# Altium schematic sheet 05-MCU.SchDoc: MCU
size A4; Organization: ORGANIZATION; Address1: ADDRESS 1; Address2: ADDRESS 2; Address3: ADDRESS 3; Address4: ADDRESS 4; SheetNumber: 5; SheetTotal: 7; ENG_APP_DATE: --/--/--; DSN_APP_DATE: --/--/--; CHK_APP_DATE: --/--/--
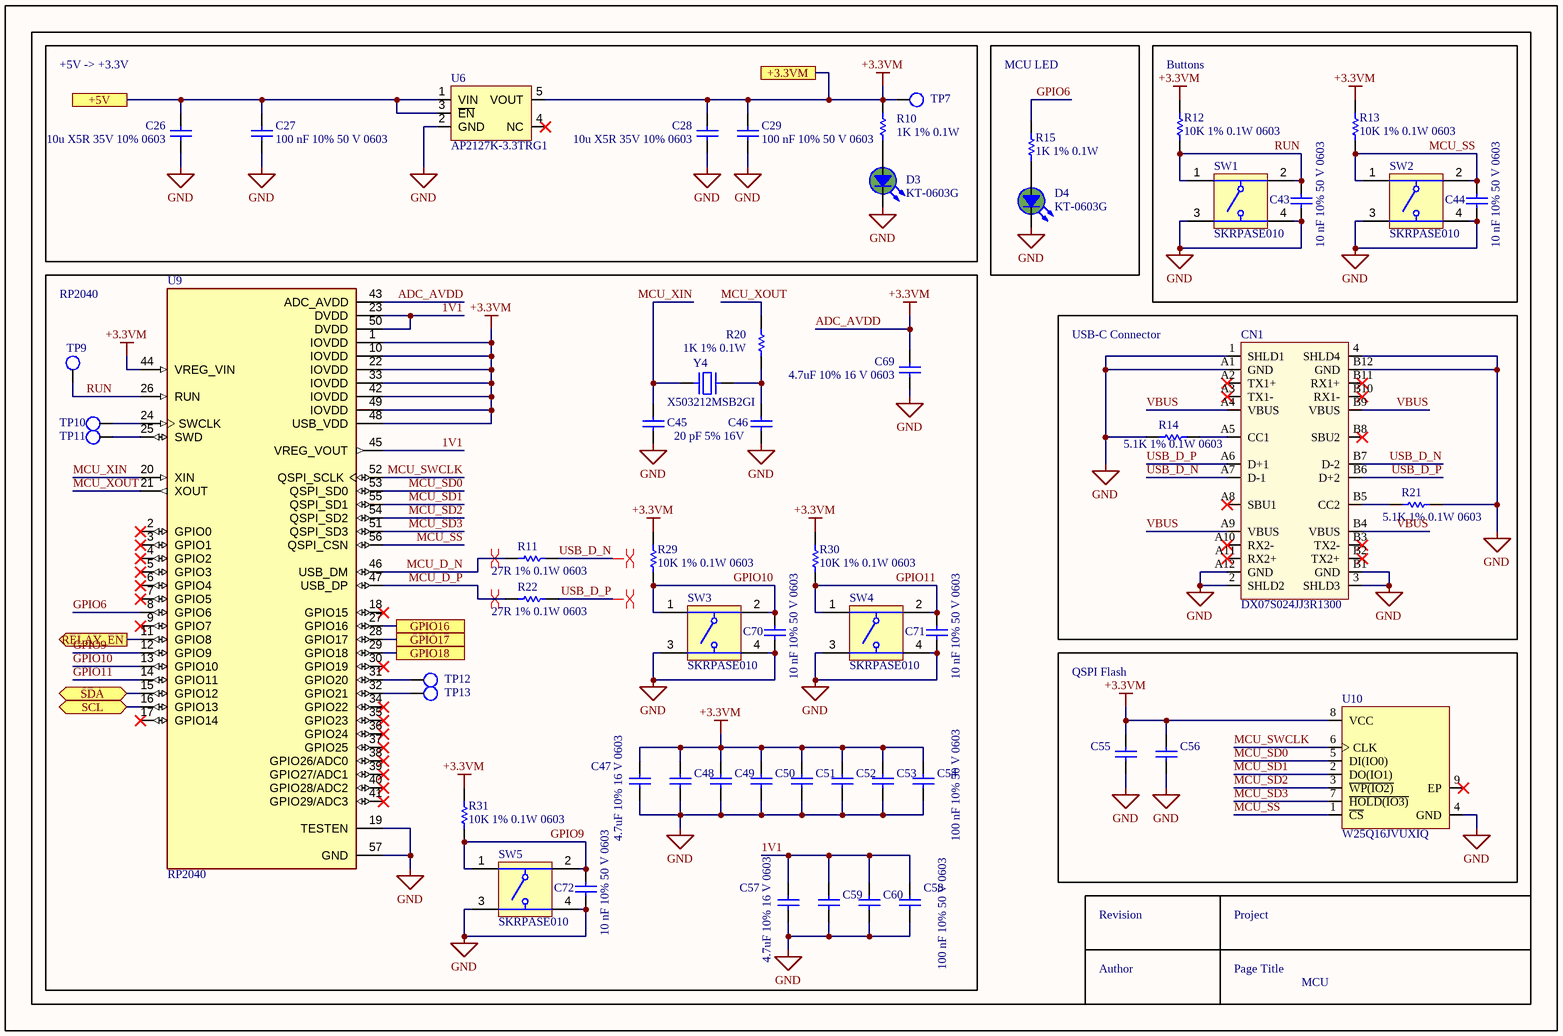
[diagram p0: 05-MCU.SchDoc]

## Parts
C26  10u X5R 35V 10% 0603  [C0603]
C27  100 nF 10% 50 V 0603  [CAPC1608X90X40NL10T20]
C28  10u X5R 35V 10% 0603  [C0603]
C29  100 nF 10% 50 V 0603  [CAPC1608X90X40NL10T20]
C43  10 nF 10% 50 V 0603  [CAPC1608X90X40NL10T20]
C44  10 nF 10% 50 V 0603  [CAPC1608X90X40NL10T20]
C45  20 pF 5% 16V  [CAPC1608X90X40NL10T20]
C46  20 pF +/- 5% 16 V 0603  [CAPC1608X90X40NL10T20]  (value not drawn)
C47  4.7uF 10% 16 V 0603  [CAPC1608X90X40NL10T20]
C48  100 nF 10% 50 V 0603  [CAPC1608X90X40NL10T20]  (value not drawn)
C49  100 nF 10% 50 V 0603  [CAPC1608X90X40NL10T20]  (value not drawn)
C50  100 nF 10% 50 V 0603  [CAPC1608X90X40NL10T20]  (value not drawn)
C51  100 nF 10% 50 V 0603  [CAPC1608X90X40NL10T20]  (value not drawn)
C52  100 nF 10% 50 V 0603  [CAPC1608X90X40NL10T20]  (value not drawn)
C53  100 nF 10% 50 V 0603  [CAPC1608X90X40NL10T20]  (value not drawn)
C54  100 nF 10% 50 V 0603  [CAPC1608X90X40NL10T20]
C55  4.7uF 10% 16 V 0603  [CAPC1608X90X40NL10T20]  (value not drawn)
C56  100 nF 10% 50 V 0603  [CAPC1608X90X40NL10T20]  (value not drawn)
C57  4.7uF 10% 16 V 0603  [CAPC1608X90X40NL10T20]
C58  100 nF 10% 50 V 0603  [CAPC1608X90X40NL10T20]
C59  100 nF 10% 50 V 0603  [CAPC1608X90X40NL10T20]  (value not drawn)
C60  100 nF 10% 50 V 0603  [CAPC1608X90X40NL10T20]  (value not drawn)
C69  4.7uF 10% 16 V 0603  [CAPC1608X90X40NL10T20]
C70  10 nF 10% 50 V 0603  [CAPC1608X90X40NL10T20]
C71  10 nF 10% 50 V 0603  [CAPC1608X90X40NL10T20]
C72  10 nF 10% 50 V 0603  [CAPC1608X90X40NL10T20]
CN1  DX07S024JJ3R1300  [JAE-DX07S024JJ3_V]
D3  KT-0603G  [LED-0603-RED]
D4  KT-0603G  [LED-0603-RED]
R10  1K 1% 0.1W  [R0603]
R11  27R 1% 0.1W 0603  [R0603]
R12  10K 1% 0.1W 0603  [R0603]
R13  10K 1% 0.1W 0603  [R0603]
R14  5.1K 1% 0.1W 0603  [R0603]
R15  1K 1% 0.1W  [R0603]
R20  1K 1% 0.1W  [R0603]
R21  5.1K 1% 0.1W 0603  [R0603]
R22  27R 1% 0.1W 0603  [R0603]
R29  10K 1% 0.1W 0603  [R0603]
R30  10K 1% 0.1W 0603  [R0603]
R31  10K 1% 0.1W 0603  [R0603]
SW1  SKRPASE010  [SKRPASE010]
SW2  SKRPASE010  [SKRPASE010]
SW3  SKRPASE010  [SKRPASE010]
SW4  SKRPASE010  [SKRPASE010]
SW5  SKRPASE010  [SKRPASE010]
TP7  Touchpoint  [Touchpoint-Footprint-1]  (value not drawn)  (no BOM)
TP9  Touchpoint  [Touchpoint-Footprint-1]  (value not drawn)  (no BOM)
TP10  Touchpoint  [Touchpoint-Footprint-1]  (value not drawn)  (no BOM)
TP11  Touchpoint  [Touchpoint-Footprint-1]  (value not drawn)  (no BOM)
TP12  Touchpoint  [Touchpoint-Footprint-1]  (value not drawn)  (no BOM)
TP13  Touchpoint  [Touchpoint-Footprint-1]  (value not drawn)  (no BOM)
U6  AP2127K-3.3TRG1  [FP-SOT25-IPC_B]
U9  RP2040  [QFN40P700X700X90-57N]
U10  W25Q16JVUXIQ  [FP-UX-IPC_B]
Y4  X503212MSB2GI  [X50328MSB2GI-Footprint-1]

## Blocks framed on the sheet
+5V -> +3.3V: C26-C29 D3 R10 TP7 U6
MCU LED: D4 R15
Buttons: C43 C44 R12 R13 SW1 SW2
RP2040: C45-C54 C57-C60 C69-C72 R11 R20 R22 R29-R31 SW3-SW5 TP9-TP13 U9 Y4
USB-C Connector: CN1 R14 R21
QSPI Flash: C55 C56 U10

## Ports
+3.3VM, +5V, GPIO16, GPIO17, GPIO18, RELAY_EN (out), SCL (bidir), SDA (bidir)

## Nets
ADC_AVDD: C28.2 C29.2 C47.2 C48.2 C49.2 C50.2 C51.2 C52.2 C53.2 C54.2 C55.2 C56.2 C69.2 R10.1 R12.2 R13.2 R29.2 R30.2 R31.2 TP7.0 U6.5(VOUT) U9.1(IOVDD) U9.10(IOVDD) U9.22(IOVDD) U9.33(IOVDD) U9.42(IOVDD) U9.43(ADC_AVDD) U9.44(VREG_VIN) U9.48(USB_VDD) U9.49(IOVDD) U10.8(VCC) ; port +3.3VM  [also labelled +3.3VM]
GND: C26.1 C27.1 C28.1 C29.1 C43.1 C44.1 C45.1 C46.1 C47.1 C48.1 C49.1 C50.1 C51.1 C52.1 C53.1 C54.1 C55.1 C56.1 C57.1 C58.1 C59.1 C60.1 C69.1 C70.1 C71.1 C72.1 CN1.1(SHLD1) CN1.2(SHLD2) CN1.3(SHLD3) CN1.4(SHLD4) CN1.A1(GND) CN1.A12(GND) CN1.B1(GND) CN1.B12(GND) D3.2 D4.2 R14.2 R21.1 SW1.3 SW1.4 SW2.3 SW2.4 SW3.3 SW3.4 SW4.3 SW4.4 SW5.3 SW5.4 U6.2(GND) U9.19(TESTEN) U9.57(GND) U10.4(GND)
1V1: C57.2 C58.2 C59.2 C60.2 U9.23(DVDD) U9.45(VREG_VOUT) U9.50(DVDD)
+5V: C26.2 C27.2 U6.1(VIN) U6.3(~{EN}) ; port +5V
GPIO6: R15.1 U9.8(GPIO6)
GPIO9: C72.2 R31.1 SW5.1 SW5.2 U9.12(GPIO9)
GPIO10: C70.2 R29.1 SW3.1 SW3.2 U9.13(GPIO10)
GPIO11: C71.2 R30.1 SW4.1 SW4.2 U9.14(GPIO11)
GPIO16: U9.27(GPIO16) ; port GPIO16
GPIO17: U9.28(GPIO17) ; port GPIO17
GPIO18: U9.29(GPIO18) ; port GPIO18
MCU_D_N: R11.1 U9.46(USB_DM)
MCU_D_P: R22.1 U9.47(USB_DP)
MCU_SD0: U9.53(QSPI_SD0) U10.5(DI(IO0))
MCU_SD1: U9.55(QSPI_SD1) U10.2(DO(IO1))
MCU_SD2: U9.54(QSPI_SD2) U10.3(~{WP(IO2)})
MCU_SD3: U9.51(QSPI_SD3) U10.7(~{HOLD(IO3)})
MCU_SS: C44.2 R13.1 SW2.1 SW2.2 U9.56(QSPI_CSN) U10.1(~{CS})
MCU_SWCLK: U9.52(QSPI_SCLK) U10.6(CLK)
MCU_XIN: C45.2 U9.20(XIN) Y4.2
MCU_XOUT: R20.2 U9.21(XOUT)
RELAY_EN: U9.11(GPIO8) ; port RELAY_EN
RUN: C43.2 R12.1 SW1.1 SW1.2 TP9.0 U9.26(RUN)
SCL: U9.16(GPIO13) ; port SCL
SDA: U9.15(GPIO12) ; port SDA
USB_D_N: CN1.A7(D-1) CN1.B7(D-2) R11.2
USB_D_P: CN1.A6(D+1) CN1.B6(D+2) R22.2
VBUS: CN1.A4(VBUS) CN1.A9(VBUS) CN1.B4(VBUS) CN1.B9(VBUS)
NetC46_2: C46.2 R20.1 Y4.1
NetCN1_A5: CN1.A5(CC1) R14.1
NetCN1_B5: CN1.B5(CC2) R21.2
NetD3_1: D3.1 R10.2
NetD4_1: D4.1 R15.2
NetTP10_0: TP10.0 U9.24(SWCLK)
NetTP11_0: TP11.0 U9.25(SWD)
NetTP12_0: TP12.0 U9.31(GPIO20)
NetTP13_0: TP13.0 U9.32(GPIO21)

Not connected (* = marked no-connect by the designer): CN1 A2(TX1+)* A3(TX1-)* A8(SBU1)* A10(RX2-)* A11(RX2+)* B2(TX2+)* B3(TX2-)* B8(SBU2)* B10(RX1-)* B11(RX1+)*; U6 4(NC)*; U9 2(GPIO0)* 3(GPIO1)* 4(GPIO2)* 5(GPIO3)* 6(GPIO4)* 7(GPIO5)* 9(GPIO7)* 17(GPIO14)* 18(GPIO15)* 30(GPIO19)* 34(GPIO22)* 35(GPIO23)* 36(GPIO24)* 37(GPIO25)* 38(GPIO26/ADC0)* 39(GPIO27/ADC1)* 40(GPIO28/ADC2)* 41(GPIO29/ADC3)*; U10 9(EP)*

## Layout directives
differential pair: MCU_D_N, MCU_D_P, USB_D_N, USB_D_P

## Notes on the sheet
- Revision
- Project
- Author
- Page Title

## Library data of the parts
C26 C28 = CMP-001-00153-3: MLCC 10u X5R 35V 10% 0603; MFR_Part_#: GRM188R6YA106MA73D; Manufacturer: Generic; Dielectric: X7R; Component Type: Standard; PartNumber: 10u X5R 35V 10% 0603; Value: 10u; LCSC_Part_#: C194427; Tolerance: 10%; Pin Count: 2; Status: Preferred; Source: GT_WH_Control.SCHLIB; Voltage: 35V; LCSC_Price_1ku: 0.0213; Design Item ID: 10u X5R 35V 10% 0603
C27 C29 C48-C54 C56 C58-C60 = CMP-001-00017-8: Chip Capacitor, 100 nF, +/- 10%, 50 V, 0603 (1608 Metric); MFR_Part_#: CC0603KRX7R9BB104; Voltage Rating: 50V; Value: 100nF; Capacitor Type: Ceramic; Mounting Technology: SM; LCSC_Price_1ku: 0.0015; Pins: 2; RoHS Compliant: True; LCSC_Part_#: C14663; Max Operating Temperature: 125°C; Tolerance: 10%; Case/Package: 0603; Min Operating Temperature: -55°C
C43 C44 C70-C72 = CMP-001-00194-3: Chip Capacitor, 10 nF, +/- 10%, 50 V, 0603 (1608 Metric); MFR_Part_#: 0603B103K500NT; Voltage Rating: 50V; Value: 10nF; Capacitor Type: Ceramic; Mounting Technology: SM; Case/Package: 0603; LCSC_Part_#: C57112; Max Operating Temperature: 125°C; Min Operating Temperature: -55°C; Tolerance: 10%; LCSC_Price_1ku: 0.0015; Pins: 2; RoHS Compliant: True
C45 C46 = CMP-001-00200-2: Chip Capacitor, 20 pF, +/- 5%, 16V, 0603 (1608 Metric); MFR_Part_#: CC0603JRNPO7BN200; Capacitor Type: Ceramic; Value: 20pF; Tolerance: 5%; Pins: 2; LCSC_Price_1ku: 0.0022; Voltage Rating: 16V; Mounting Technology: SM; LCSC_Part_#: C2190570; Min Operating Temperature: -55°C; Case/Package: 0603; RoHS Compliant: True
C47 C55 C57 C69 = CMP-001-00201-1: Chip Capacitor, 4.7uF, +/- 10%, 16V, 0603 (1608 Metric); MFR_Part_#: CL10A475KO8NNNC; Capacitor Type: Ceramic; LCSC_Part_#: C19666; Voltage Rating: 16V; LCSC_Price_1ku: 0.0063; Pins: 2; RoHS Compliant: True; Value: 4.7uF; Case/Package: 0603; Tolerance: 10%; Min Operating Temperature: -55°C; Max Operating Temperature: 125°C; Mounting Technology: SM
CN1 = CMP-002-00065-4: USB-C Connector, 20 V, 1.25 A, -30 to 80 degC, RoHS, Tape and Reel; Gender: Receptacle; Pins: 28; Connector Type: USB-C
D3 D4 = CMP-007-00044-3: 0603 Green LED; MFR_Part_#: KT-0603G; LCSC_Price_1ku: 0.0068; LCSC_Part_#: C12624
R10 R15 R20 = CMP-009-00312-2: Standard Resistor 1K 1% 0.1W 0603; MFR_Part_#: 0603WAF1001T5E; Manufacturer: Generic; TC: 200; Tolerance: 1%; LCSC_Part_#: C21190; Value: 1K; LCSC_Price_1ku: 0.0007; Power: 0.1W; Pin Count: 2; PartNumber: 1K 1% 0.1W 0603; Design Item ID: 1K 1% 0.1W 0603; Component Type: Standard; Source: GT_WH_Control.SCHLIB
R11 R22 = CMP-009-00348-1: Standard Resistor 27R 1% 0.1W 0603; Manufacturer: Generic; MFR_Part_#: 0603WAJ0270T5E; TC: 200; Power: 0.1W; Source: GT_WH_Control.SCHLIB; Design Item ID: 27R 1% 0.1W 0603; Tolerance: 1%; PartNumber: 27R 1% 0.1W 0603; Value: 27R; Component Type: Standard; Pin Count: 2; LCSC_Part_#: C25224; LCSC_Price_1ku: 0.0007
R12 R13 R29-R31 = CMP-356-000043-3: Standard Resistor 10K 1% 0.1W 0603; Manufacturer: Generic; MFR_Part_#: 0603WAF1002T5E; TC: 200; Design Item ID: 10K 1% 0.1W 0603; Tolerance: 1%; LCSC_Price_1ku: 0.0007; Value: 10K; PartNumber: 10K 1% 0.1W 0603; LCSC_Part_#: C25804; Component Type: Standard; Source: GT_WH_Control.SCHLIB; Pin Count: 2; Power: 0.1W
R14 R21 = CMP-009-00322-2: Standard Resistor 5.1K 1% 0.1W 0603; MFR_Part_#: 0603WAF5101T5E; Manufacturer: Generic; TC: 200; Tolerance: 1%; Source: GT_WH_Control.SCHLIB; Component Type: Standard; LCSC_Price_1ku: 0.0007; Pin Count: 2; Power: 0.1W; Value: 5.1K; PartNumber: 5.1K 1% 0.1W 0603; Design Item ID: 5.1K 1% 0.1W 0603; LCSC_Part_#: C23186
SW1-SW5 = CMP-479-000000-4: Tactile Switches 500mOhm 2.55N 16VDC 4.2X3.2X2.5MM 50mA; Manufacturer_Name: ALPS Electric; Geometry.Height: 2.5mm; Mouser Price/Stock: https://www.mouser.co.uk/ProductDetail/Alps-Alpine/SKRPASE010?qs=byeeYqUIh0NdKk8WD590Nw%3D%3D; Datasheet Link: https://www.mouser.ca/ProductDetail/ALPS/SKRPASE010?qs=byeeYqUIh0NdKk8WD590Nw%3D%3D; Mouser Part Number: 688-SKRPASE010; Manufacturer_Part_Number: SKRPASE010; Design Item ID: SKRPASE010; Source: SKRPASE010.SchLib; LCSC_Part_#: C470427; LCSC_Price_1ku: 0.0694; MFR_Part_#: SKRPASE010
TP7 TP9-TP13 = CMP-001-0002-2: 60mils touchpoint
U6 = CMP-019-00060-1: IC REG LDO 3.3V 0.3A SOT23-5; MFR: Diodes Incorporated; LCSC_Price_1ku: 0.0388; LCSC_Part_#: C156285; MFR_Part_#: AP2127K-3.3TRG1
U9 = CMP-547-000000-2: 133MHz LQFN-56(7x7) Microcontrollers (MCU/MPU/SOC) ROHS ARM® Cortex®-M0+ MCU 32-Bit; MFR: Raspberry Pi; MFR_Part_#: RP2040; LCSC_Part_#: C2040; LCSC_Price_1ku: 0.6733
U10 = CMP-019-00061-1: 16Mb Serial NOR Flash 133MHz USON8; MFR: Winbond Elec; MFR_Part_#: W25Q16JVUXIQ; LCSC_Part_#: C2843335; LCSC_Price_1ku: 0.2127
Y4 = CMP-003-00035-1: 12MHz Surface Mount Crystal 20pF ±10ppm ±20ppm SMD5032 Crystals ROHS; Manufacturer: YXC; MFR_Part_#: X503212MSB2GI; LCSC_Part_#: C112573; LCSC_Price_1ku: 0.1205